# EasyEDA schematic schematic.json
TITLE: Sheet_1; REV: 1.0; Date: 2026-10-22; Sheet: 1/1; Drawn By: Farouk; Company: Your Company
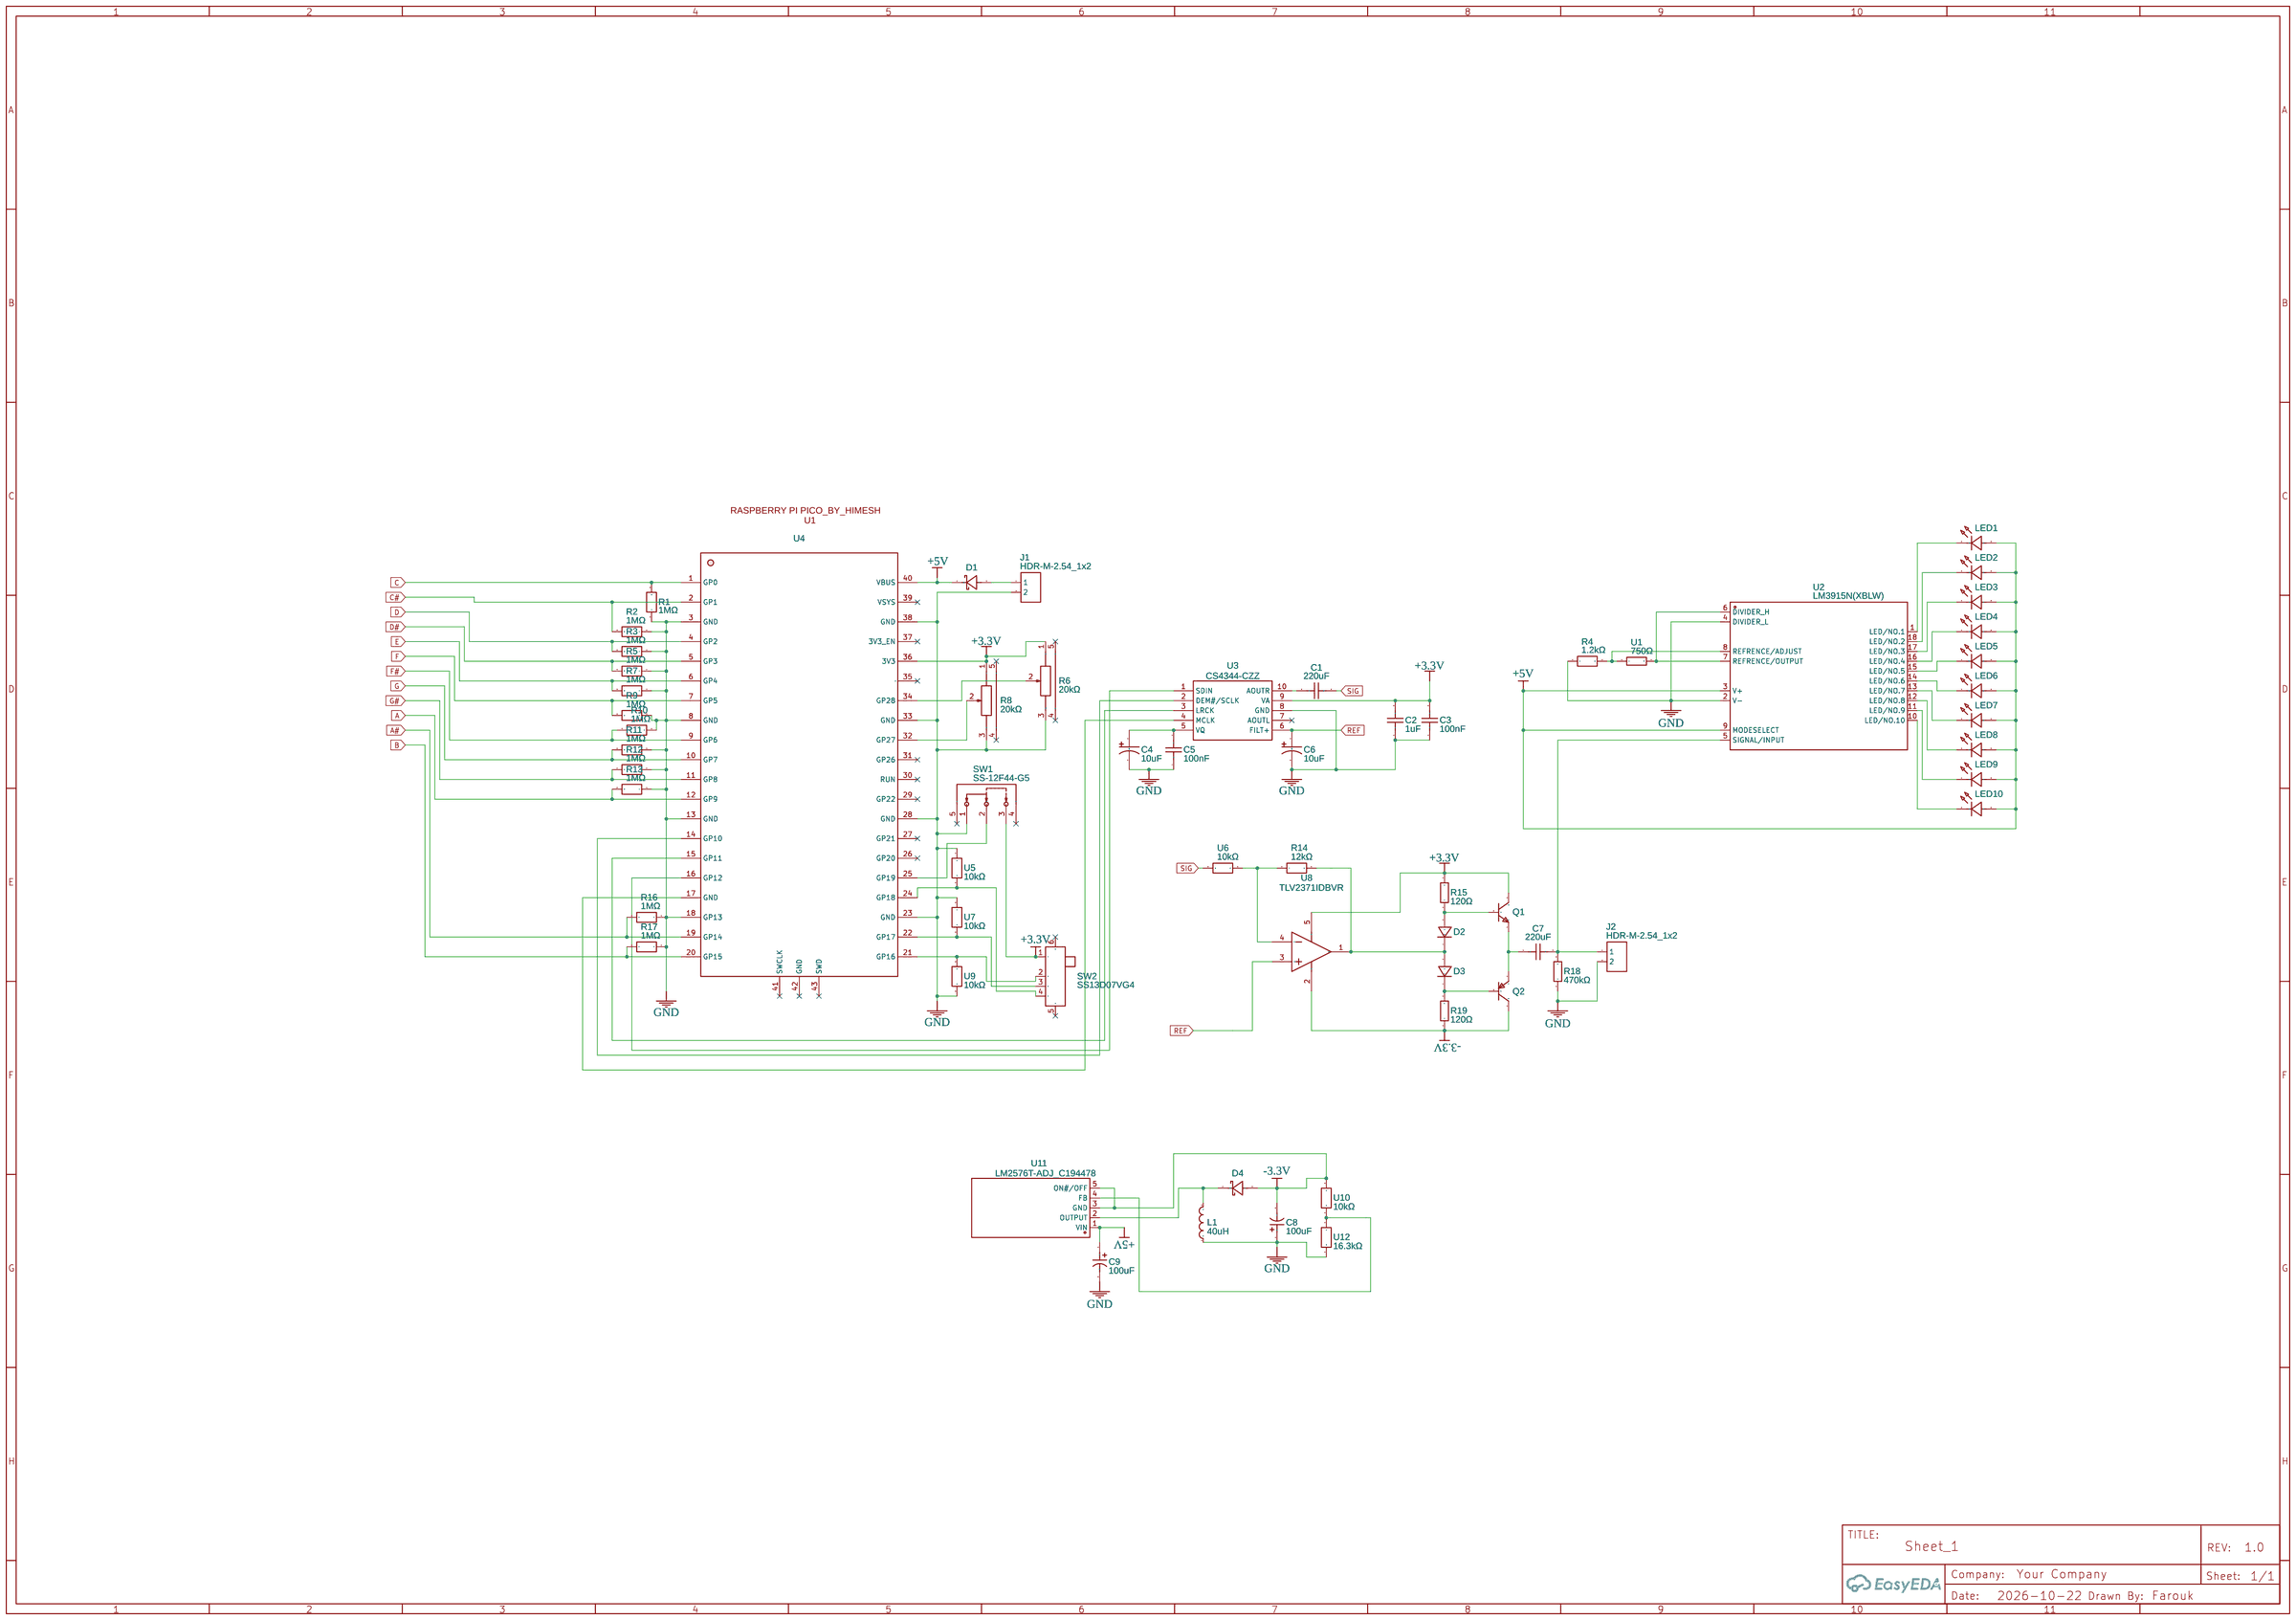
[diagram p0: schematic sheet]

## Parts
C1  220uF  [C1210]
C2  1uF  [CAP-TH_L7.2-W6.0-P5.00-D0.6_RED]
C3  100nF  [CAP-TH_L5.8-W3.6-P5.0-D0.6]
C4  10uF  [CAP-TH_BD5.0-P2.00-D0.8-FD]
C5  100nF  [CAP-TH_L5.8-W3.6-P5.0-D0.6]
C6  10uF  [CAP-TH_BD5.0-P2.00-D0.8-FD]
C7  220uF  [C1210]
C8  100uF  [CAP-TH_BD8.0-P3.50-D0.8-FD]
C9  100uF  [CAP-SMD_BD6.3-L6.6-W6.6-LS7.2-FD_3]
D1  SS14_C47147601  [SMA_L4.3-W2.6-LS5.0-RD]
D2  1N4148_C402212  [DO-35_BD2.0-L4.2-P8.20-D0.5-RD]
D3  1N4148_C402212  [DO-35_BD2.0-L4.2-P8.20-D0.5-RD]
D4  SS14_C47147601  [SMA_L4.3-W2.6-LS5.0-RD]
J1  HDR-M-2.54_1x2  [HDR-M-2.54_1X2]
J2  HDR-M-2.54_1x2  [HDR-M-2.54_1X2]
L1  40uH  [IND-TH_BD11.0-P5.00-D0.6]
LED1  GL3528UG01  [LED-SMD_L3.5-W2.8-RD_RED]
LED2  GL3528UG01  [LED-SMD_L3.5-W2.8-RD_RED]
LED3  GL3528UG01  [LED-SMD_L3.5-W2.8-RD_RED]
LED4  GL3528UG01  [LED-SMD_L3.5-W2.8-RD_RED]
LED5  GL3528UG01  [LED-SMD_L3.5-W2.8-RD_RED]
LED6  GL3528UG01  [LED-SMD_L3.5-W2.8-RD_RED]
LED7  GL3528UG01  [LED-SMD_L3.5-W2.8-RD_RED]
LED8  GL3528UG01  [LED-SMD_L3.5-W2.8-RD_RED]
LED9  GL3528UG01  [LED-SMD_L3.5-W2.8-RD_RED]
LED10  GL3528UG01  [LED-SMD_L3.5-W2.8-RD_RED]
Q1  BD139_C49009574  [TO-126-3_L7.6-W2.7-P2.30-L]
Q2  BD140_C20604  [TO-126_L8.3-W3.5-P2.29-T]
R1  1MΩ  [RES-TH_BD2.4-L6.3-P10.30-D0.6]
R2  1MΩ  [RES-TH_BD2.4-L6.3-P10.30-D0.6]
R3  1MΩ  [RES-TH_BD2.4-L6.3-P10.30-D0.6]
R4  1.2kΩ  [RES-TH_BD2.7-L6.2-P10.20-D0.4]
R5  1MΩ  [RES-TH_BD2.4-L6.3-P10.30-D0.6]
R6  20kΩ  [RES-TH_RK09K1130ACM]
R7  1MΩ  [RES-TH_BD2.4-L6.3-P10.30-D0.6]
R8  20kΩ  [RES-TH_RK09K1130ACM]
R9  1MΩ  [RES-TH_BD2.4-L6.3-P10.30-D0.6]
R10  1MΩ  [RES-TH_BD2.4-L6.3-P10.30-D0.6]
R11  1MΩ  [RES-TH_BD2.4-L6.3-P10.30-D0.6]
R12  1MΩ  [RES-TH_BD2.4-L6.3-P10.30-D0.6]
R13  1MΩ  [RES-TH_BD2.4-L6.3-P10.30-D0.6]
R14  12kΩ  [RES-TH_BD2.2-L6.5-P10.50-D0.6]
R15  120Ω  [RES-TH_BD3.3-L9.0-P13.00-D0.6]
R16  1MΩ  [RES-TH_BD2.4-L6.3-P10.30-D0.6]
R17  1MΩ  [RES-TH_BD2.4-L6.3-P10.30-D0.6]
R18  470kΩ  [RES-TH_BD3.3-L9.0-P13.00-D0.6]
R19  120Ω  [RES-TH_BD3.3-L9.0-P13.00-D0.6]
SW1  SS-12F44-G5  [SW-TH_SS-12F44-G5]
SW2  SS13D07VG4  [SW-TH_SS13D07VG4]
U1  750Ω  [RES-TH_BD2.3-L3.7-P7.70-D0.9]
U2  LM3915N(XBLW)  [PDIP-18_L22.9-W6.4-P2.54-LS7.9-BL]
U3  CS4344-CZZ  [TSSOP-10_L3.0-W3.0-P0.50-LS4.9-BL]
U4  RASPBERRY PI PICO 2  [PICO_FOOTPRINT_BY_HIMESH 2.0]
U5  10kΩ  [RES-TH_BD2.4-L6.3-P10.30-D0.6]
U6  10kΩ  [RES-TH_BD2.4-L6.3-P10.30-D0.6]
U7  10kΩ  [RES-TH_BD2.4-L6.3-P10.30-D0.6]
U8  TLV2371IDBVR  [SOT-23-5_L3.0-W1.7-P0.95-LS2.8-BR]
U9  10kΩ  [RES-TH_BD2.4-L6.3-P10.30-D0.6]
U10  10kΩ  [RES-TH_BD2.4-L6.3-P10.30-D0.6]
U11  LM2576T-ADJ_C194478  [TO-220-5L_L10.2-W4.5-P1.71-L]
U12  16.3kΩ  [RES-TH_BD2.3-L3.7-P7.70-D0.4]

## Library data of the parts
C1 C7 = CL32A227MQVNNNE: Contributor: LCSC; Supplier: LCSC; Supplier Part: C400951; Manufacturer: SAMSUNG(三星); JLCPCB Part Class: Extended Part
C2 = MES105J2A-7-50R0: Contributor: LCSC; Supplier: LCSC; Supplier Part: C333829; Manufacturer: HEL(鸿志); JLCPCB Part Class: Extended Part
C3 C5 = 178MU0002: Supplier: LCSC; Supplier Part: C5632426; Manufacturer: KNSCHA(科尼盛); Contributor: lcsc; JLCPCB Part Class: Extended Part
C4 C6 = ECR1HBK100MLL050011: Contributor: LCSC; Supplier: LCSC; Supplier Part: C192100; Manufacturer: Jianghai(南通江海); JLCPCB Part Class: Extended Part
C8 = RD1J107M0811MPF: Supplier: LCSC; Supplier Part: C18214353; Manufacturer: SAMWHA(三和); JLCPCB Part Class: Extended Part; Contributor: lcsc
C9 = RVT100UF35V34RV0158: Contributor: LCSC; Supplier: LCSC; Supplier Part: C2887272; Manufacturer: KNSCHA(科尼盛); Manufacturer Part: VT100UF35V34RV0158; JLCPCB Part Class: Extended Part
D1 D4 = SS14_C47147601: Supplier: LCSC; Supplier Part: C47147601; Manufacturer: YONGYUTAI(永裕泰); Manufacturer Part: SS14; JLCPCB Part Class: Extended Part; Contributor: lcsc
D2 D3 = 1N4148_C402212: Contributor: LCSC; Supplier: LCSC; Supplier Part: C402212; Manufacturer: LGE(鲁光); Manufacturer Part: 1N4148; JLCPCB Part Class: Extended Part
J1 J2 = HDR-M-2.54_1x2: Supplier Part: C124375; Supplier: LCSC; Contributor: LCEDA_Lib
L1 = YDPK0810-400K: Supplier: LCSC; Supplier Part: C22395835; Manufacturer: YJYCOIN(益嘉源); JLCPCB Part Class: Extended Part; Contributor: lcsc
LED1-LED10 = GL3528UG01: Supplier: LCSC; Supplier Part: C51933337; Manufacturer: Guiguang light(桂光光电); JLCPCB Part Class: Extended Part; Contributor: lcsc
Q1 = BD139_C49009574: Supplier: LCSC; Supplier Part: C49009574; Manufacturer: ChipNobo(无边界); Manufacturer Part: BD139; JLCPCB Part Class: Extended Part; Contributor: lcsc
Q2 = BD140_C20604: Contributor: LCSC; Supplier: LCSC; Supplier Part: C20604; Manufacturer: CJ(江苏长电/长晶); Manufacturer Part: BD140; JLCPCB Part Class: Extended Part
R1-R3 R5 R7 R9-R13 R16 R17 = FMP100JR-52-1M: Supplier: LCSC; Supplier Part: C1740216; Manufacturer: YAGEO(国巨); JLCPCB Part Class: Extended Part; Contributor: lcsc
R4 = CR1/4W-1K2±5%-ST26: Contributor: lcsc; Supplier: LCSC; Supplier Part: C2894607; Manufacturer: VO(翔胜); JLCPCB Part Class: Extended Part
R6 R8 = RK09K1130ACM: Supplier: LCSC; Supplier Part: C470290; Manufacturer: ALPSALPINE(阿尔卑斯阿尔派); JLCPCB Part Class: Extended Part; Contributor: lcsc
R14 = MF0W4FF1202A50: Supplier: LCSC; Supplier Part: C20625192; Manufacturer: UNI-ROYAL(厚声); JLCPCB Part Class: Extended Part; Contributor: lcsc
R15 R19 = RN1WS120ΩFT/BA1: Contributor: LCSC; Supplier: LCSC; Supplier Part: C385275; Manufacturer: Tyohm(幸亚电阻); JLCPCB Part Class: Extended Part
R18 = MFR01SF4703A10: Supplier: LCSC; Manufacturer: UNI-ROYAL(厚声); Supplier Part: C58698; JLCPCB Part Class: Extended Part
SW1 = SS-12F44-G5: Contributor: LCSC; Supplier: LCSC; Supplier Part: C136718; Manufacturer: 韩国韩荣; JLCPCB Part Class: Extended Part
SW2 = SS13D07VG4: Contributor: LCSC; Supplier: LCSC; Supplier Part: C2681578; Manufacturer: SHOU HAN(首韩); JLCPCB Part Class: Extended Part
U1 = CR1/8W-750Ω±5%-ST52: Contributor: lcsc; Supplier: LCSC; Supplier Part: C2848523; Manufacturer: VO(翔胜); JLCPCB Part Class: Extended Part
U2 = LM3915N(XBLW): Supplier: LCSC; Supplier Part: C55109574; Manufacturer: XBLW(芯伯乐); Contributor: lcsc; JLCPCB Part Class: Extended Part
U3 = CS4344-CZZ: Supplier: LCSC; Manufacturer: Cirrus Logic(凌云); Manufacturer Part: CS4344-CZZR; Supplier Part: C8952; JLCPCB Part Class: Extended Part
U4 = RASPBERRY PI PICO 2: Manufacturer Part: Raspberry Pi Pico; Contributor: liamerros.gotuato
U5-U7 U9 U10 = MFP-25BRD52-10K: Contributor: lcsc; Supplier: LCSC; Supplier Part: C2655488; Manufacturer: YAGEO(国巨); JLCPCB Part Class: Extended Part
U8 = TLV2371IDBVR: Supplier: LCSC; Manufacturer: TI(德州仪器); Supplier Part: C55940; JLCPCB Part Class: Extended Part
U11 = LM2576T-ADJ_C194478: Contributor: LCSC; Supplier: LCSC; Supplier Part: C194478; Manufacturer: HGSEMI(华冠); Manufacturer Part: LM2576T-ADJ; JLCPCB Part Class: Extended Part
U12 = MF1/8W-16K3±1%-ST52: Contributor: lcsc; Supplier: LCSC; Supplier Part: C2903325; Manufacturer: VO(翔胜); JLCPCB Part Class: Extended Part

## Nets
+3.3V: C2.2 C3.2 Q1.2(C) R6.1 R8.1 R15.2 SW1.3 SW2.1 U3.9(VA) U4.36(3V3) U8.5(VDD)
+5V: C9.1 D1.1(C) LED1.2(A) LED2.2(A) LED3.2(A) LED4.2(A) LED5.2(A) LED6.2(A) LED7.2(A) LED8.2(A) LED9.2(A) LED10.2(A) U2.3(V+) U2.9(MODESELECT) U4.40(VBUS) U11.1(VIN)
-3.3V: C8.2 D4.2(A) Q2.2(C) R19.1 U8.2(GND) U10.2 U11.3(GND) U11.5(ON#/OFF)
GND: C2.1 C3.1 C4.2 C5.1 C6.2 C8.1 C9.2 J1.2 J2.2 L1.1 R1.1 R2.1 R3.1 R4.1 R5.1 R6.3 R7.1 R8.3 R9.1 R10.1 R11.1 R12.1 R13.1 R16.1 R17.1 R18.1 SW1.1 U2.2(V-) U2.4(DIVIDER_L) U3.8(GND) U4.3(GND) U4.8(GND) U4.13(GND) U4.18(GP13) U4.23(GND) U4.28(GND) U4.33(GND) U4.38(GND) U5.1 U7.1 U9.2 U12.2
A: R13.2 U4.12(GP9)
A#: R16.2 U4.19(GP14)
B: R17.2 U4.20(GP15)
C: R1.2 U4.1(GP0)
C#: R2.2 U4.2(GP1)
D: R3.2 U4.4(GP2)
D#: R5.2 U4.5(GP3)
E: R7.2 U4.6(GP4)
F: R9.2 U4.7(GP5)
F#: R10.2 U4.9(GP6)
G: R11.2 U4.10(GP7)
G#: R12.2 U4.11(GP8)
REF: C6.1 U3.6(FILT+) U8.3(IN+)
SIG: C1.2 U6.2
Net-(C1-1): C1.1 U3.10(AOUTR)
Net-(C4-1): C4.1 C5.2 U3.5(VQ)
Net-(C7-1): C7.1 Q1.1(E) Q2.1(E)
Net-(C7-2): C7.2 J2.1 R18.2 U2.5(SIGNAL/INPUT)
Net-(D1-2): D1.2(A) J1.1
Net-(D2-1): D2.1(C) D3.2(A) R14.2 U8.1(OUT)
Net-(D2-2): D2.2(A) Q1.3(B) R15.1
Net-(D3-1): D3.1(C) Q2.3(B) R19.2
Net-(D4-1): D4.1(C) L1.2 U11.2(OUTPUT)
Net-(LED1-1): LED1.1(C) U2.1(LED/NO.1)
Net-(LED2-1): LED2.1(C) U2.18(LED/NO.2)
Net-(LED3-1): LED3.1(C) U2.17(LED/NO.3)
Net-(LED4-1): LED4.1(C) U2.16(LED/NO.4)
Net-(LED5-1): LED5.1(C) U2.15(LED/NO.5)
Net-(LED6-1): LED6.1(C) U2.14(LED/NO.6)
Net-(LED7-1): LED7.1(C) U2.13(LED/NO.7)
Net-(LED8-1): LED8.1(C) U2.12(LED/NO.8)
Net-(LED9-1): LED9.1(C) U2.11(LED/NO.9)
Net-(LED10-1): LED10.1(C) U2.10(LED/NO.10)
Net-(R4-2): R4.2 U1.1 U2.8(REFRENCE/ADJUST)
Net-(R6-2): R6.2 U4.34(GP28)
Net-(R8-2): R8.2 U4.32(GP27)
Net-(R14-1): R14.1 U6.1 U8.4(IN-)
Net-(SW1-2): SW1.2 U4.25(GP19)
Net-(SW2-2): SW2.2 U4.21(GP16) U9.1
Net-(SW2-3): SW2.3 U4.22(GP17) U7.2
Net-(SW2-4): SW2.4 U4.24(GP18) U5.2
Net-(U1-2): U1.2 U2.6(DIVIDER_H) U2.7(REFRENCE/OUTPUT)
Net-(U3-1): U3.1(SDIN) U4.16(GP12)
Net-(U3-2): U3.2(DEM#/SCLK) U4.14(GP10)
Net-(U3-3): U3.3(LRCK) U4.15(GP11)
Net-(U3-4): U3.4(MCLK) U4.17(GND)
Net-(U10-1): U10.1 U11.4(FB) U12.1

Not connected (* = marked no-connect by the designer): R6 4* 5*; R8 4* 5*; SW1 4* 5*; SW2 5* 6*; U3 7(AOUTL)*; U4 26(GP20)* 27(GP21)* 29(GP22)* 30(RUN)* 31(GP26)* 35* 37(3V3_EN)* 39(VSYS)* 41(SWCLK)* 42(GND)* 43(SWD)*
